# Altium schematic sheet 07-FLASH QCMI SOM.SchDoc: eMMC/QSPI
size 431 x 279 mm; Designer: B. Jordan; DsnPath: G:\My Drive\Quilter Computer - Engineering Assets\NXP i.MX8M-Mini\8MMINILPD4-CPU2-DESIGNFILES\8MMINILPD4-CPU2-DESIGNFILES\SCH-47712_A4.DSN; Author: B. Jordan; DrawnBy: B. Jordan; Revision: 0; SheetNumber: 07; SheetTotal: 10; ENG_APP_DATE: --/--/--; DSN_APP_DATE: --/--/--; CHK_APP_DATE: --/--/--
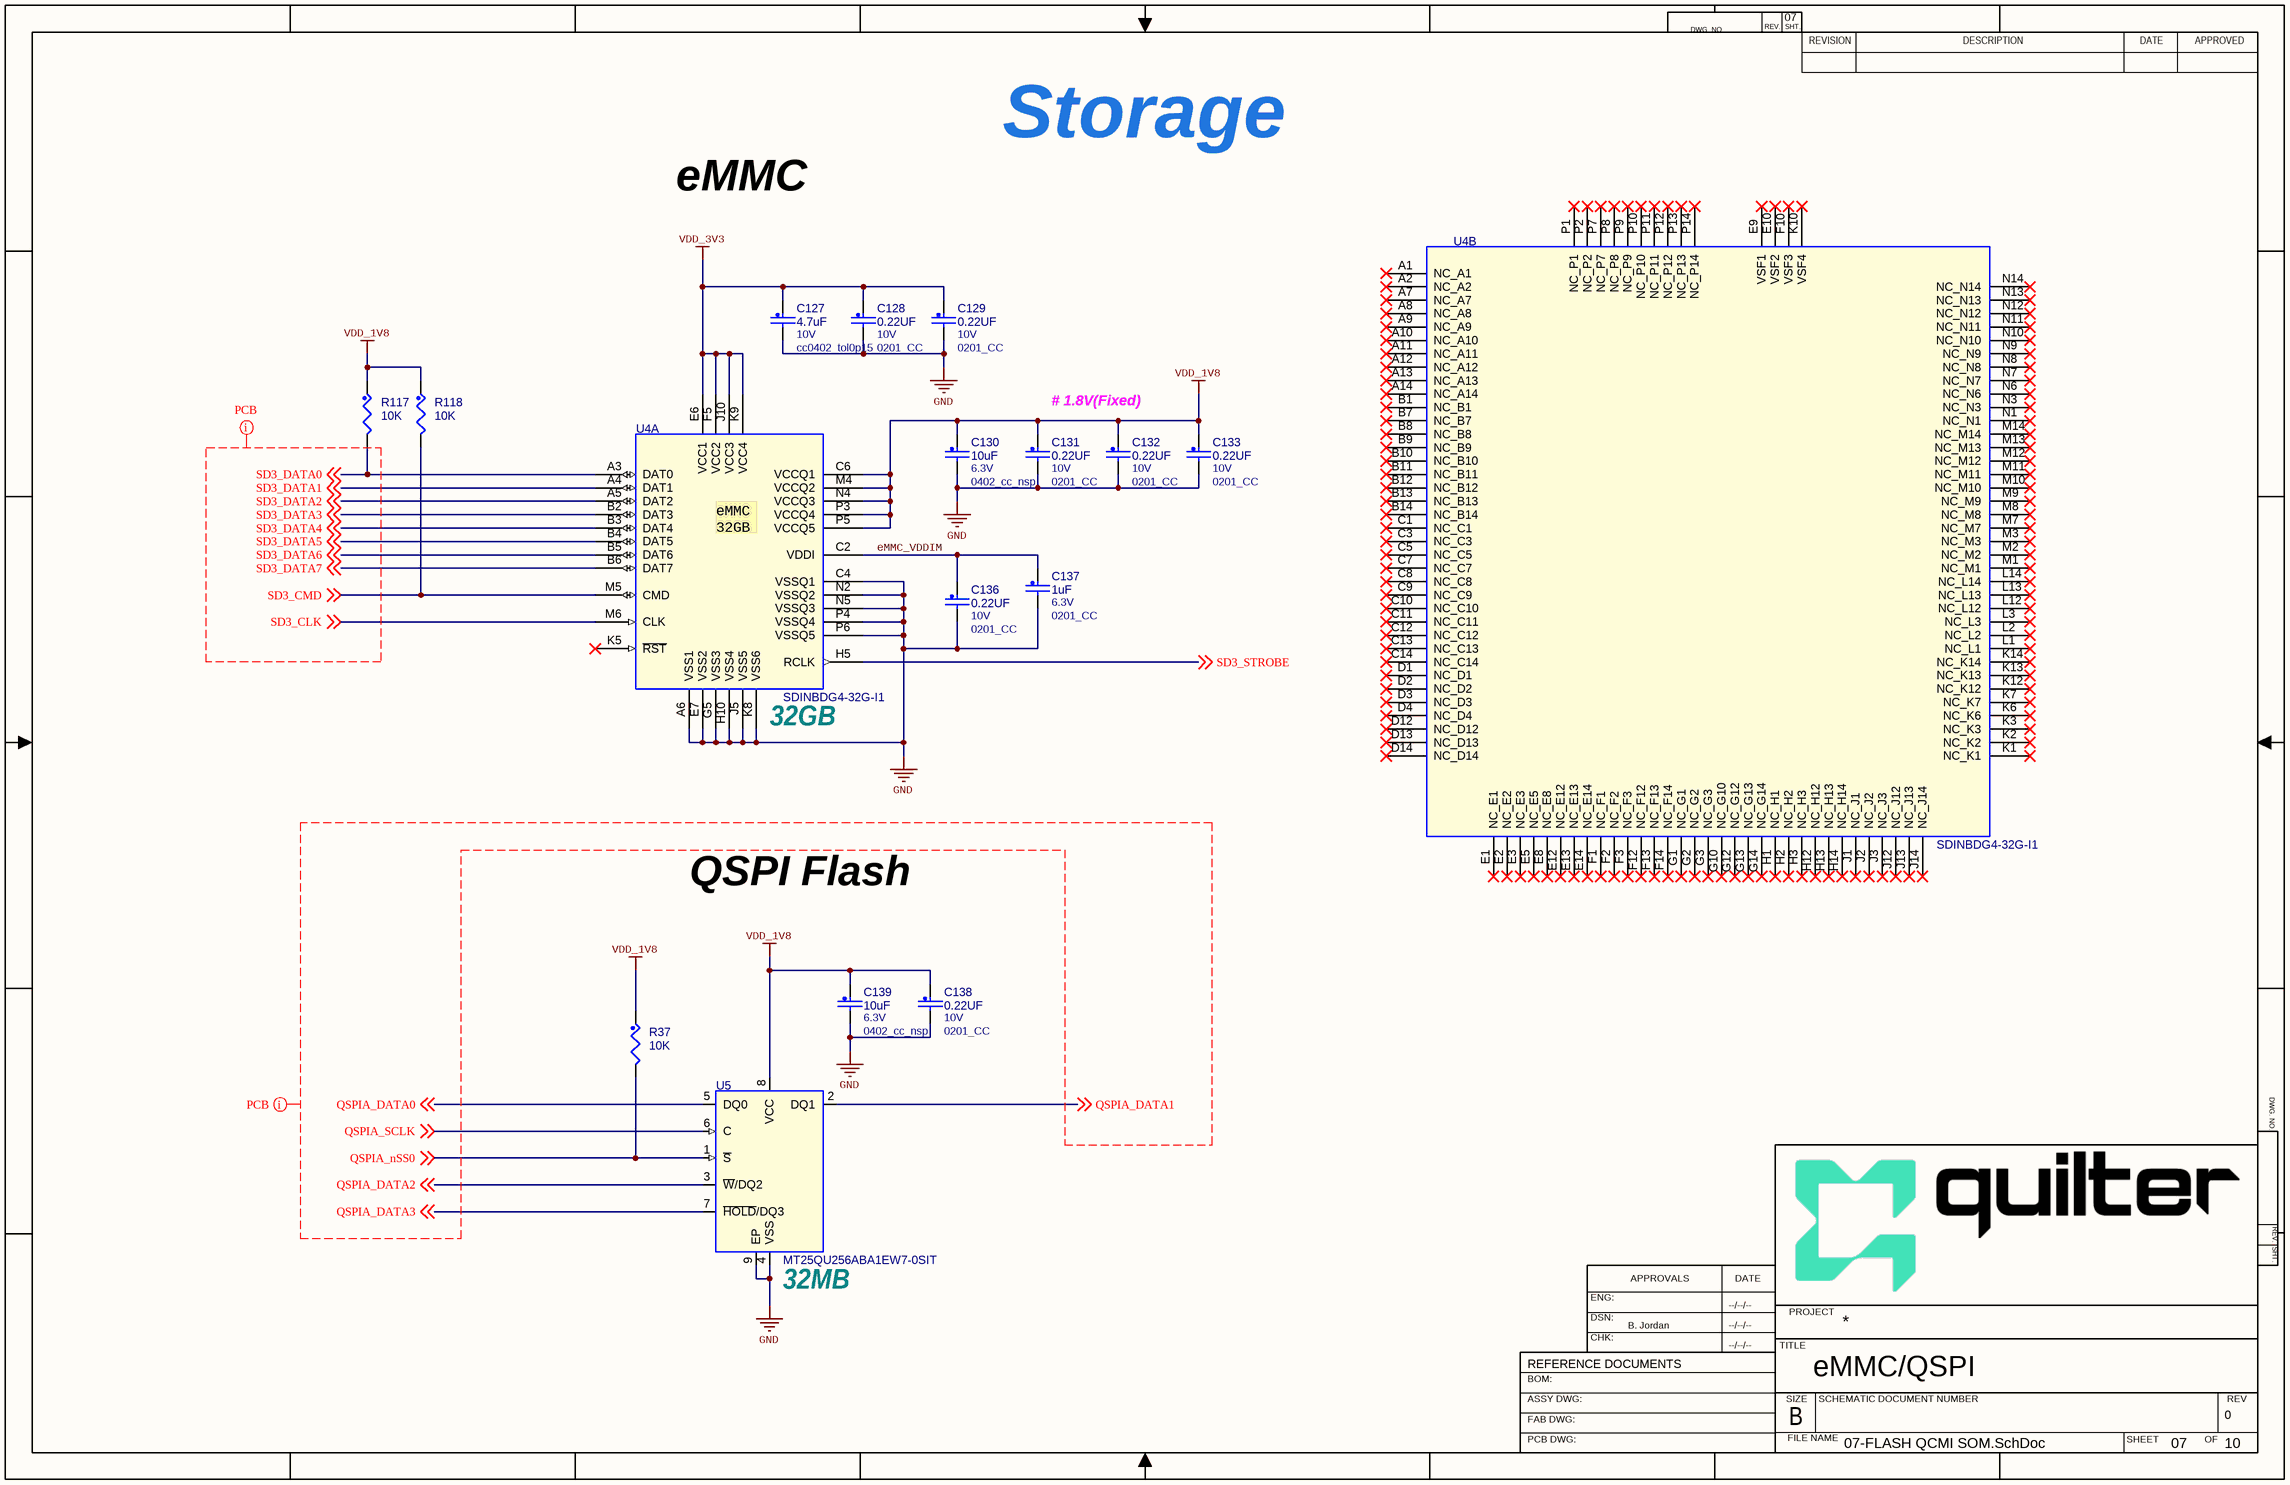
[diagram p0: 07-FLASH QCMI SOM.SchDoc]

## Parts
C127  4.7uF  VOLTAGE: 10V  [cc0402_tol0p15]
C128  0.22UF  VOLTAGE: 10V  [0201_CC]
C129  0.22UF  VOLTAGE: 10V  [0201_CC]
C130  10uF  VOLTAGE: 6.3V  [0402_cc_nsp]
C131  0.22UF  VOLTAGE: 10V  [0201_CC]
C132  0.22UF  VOLTAGE: 10V  [0201_CC]
C133  0.22UF  VOLTAGE: 10V  [0201_CC]
C136  0.22UF  VOLTAGE: 10V  [0201_CC]
C137  1uF  VOLTAGE: 6.3V  [0201_CC]
C138  0.22UF  VOLTAGE: 10V  [0201_CC]
C139  10uF  VOLTAGE: 6.3V  [0402_cc_nsp]
R37  10K  [0402_CC]
R117  10K  [0201_CC]
R118  10K  [0201_CC]
U4  SDINBDG4-32G-I1  [fbga153_0p5_11p5x13]  (parts A,B of 2)
U5  MT25QU256ABA1EW7-0SIT  [dfn8_1p27_6x5mm_3p1]

## Nets
GND: C127.2 C128.2 C129.2 C130.2 C131.2 C132.2 C133.2 C136.2 C137.2 C138.2 C139.2 U4.A6(VSS1) U4.C4(VSSQ1) U4.E7(VSS2) U4.G5(VSS3) U4.H10(VSS4) U4.J5(VSS5) U4.K8(VSS6) U4.N2(VSSQ2) U4.N5(VSSQ3) U4.P4(VSSQ4) U4.P6(VSSQ5) U5.4(VSS) U5.9(EP)
VDD_1V8: C130.1 C131.1 C132.1 C133.1 C138.1 C139.1 R37.1 R117.1 R118.1 U4.C6(VCCQ1) U4.M4(VCCQ2) U4.N4(VCCQ3) U4.P3(VCCQ4) U4.P5(VCCQ5) U5.8(VCC)
VDD_3V3: C127.1 C128.1 C129.1 U4.E6(VCC1) U4.F5(VCC2) U4.J10(VCC3) U4.K9(VCC4)
eMMC_VDDIM: C136.1 C137.1 U4.C2(VDDI)
QSPIA_DATA0: U5.5(DQ0) ; off-sheet QSPIA_DATA0
QSPIA_DATA1: U5.2(DQ1) ; off-sheet QSPIA_DATA1
QSPIA_DATA2: U5.3(~{W}/DQ2) ; off-sheet QSPIA_DATA2
QSPIA_DATA3: U5.7(~{HOLD}/DQ3) ; off-sheet QSPIA_DATA3
QSPIA_nSS0: R37.2 U5.1(~{S}) ; off-sheet QSPIA_nSS0
QSPIA_SCLK: U5.6(C) ; off-sheet QSPIA_SCLK
SD3_CLK: U4.M6(CLK) ; off-sheet SD3_CLK
SD3_CMD: R118.2 U4.M5(CMD) ; off-sheet SD3_CMD
SD3_DATA0: R117.2 U4.A3(DAT0) ; off-sheet SD3_DATA0
SD3_DATA1: U4.A4(DAT1) ; off-sheet SD3_DATA1
SD3_DATA2: U4.A5(DAT2) ; off-sheet SD3_DATA2
SD3_DATA3: U4.B2(DAT3) ; off-sheet SD3_DATA3
SD3_DATA4: U4.B3(DAT4) ; off-sheet SD3_DATA4
SD3_DATA5: U4.B4(DAT5) ; off-sheet SD3_DATA5
SD3_DATA6: U4.B5(DAT6) ; off-sheet SD3_DATA6
SD3_DATA7: U4.B6(DAT7) ; off-sheet SD3_DATA7
SD3_STROBE: U4.H5(RCLK) ; off-sheet SD3_STROBE

Not connected (* = marked no-connect by the designer): U4 A1(NC_A1)* A2(NC_A2)* A7(NC_A7)* A8(NC_A8)* A9(NC_A9)* A10(NC_A10)* A11(NC_A11)* A12(NC_A12)* A13(NC_A13)* A14(NC_A14)* B1(NC_B1)* B7(NC_B7)* B8(NC_B8)* B9(NC_B9)* B10(NC_B10)* B11(NC_B11)* B12(NC_B12)* B13(NC_B13)* B14(NC_B14)* C1(NC_C1)* C3(NC_C3)* C5(NC_C5)* C7(NC_C7)* C8(NC_C8)* C9(NC_C9)* C10(NC_C10)* C11(NC_C11)* C12(NC_C12)* C13(NC_C13)* C14(NC_C14)* D1(NC_D1)* D2(NC_D2)* D3(NC_D3)* D4(NC_D4)* D12(NC_D12)* D13(NC_D13)* D14(NC_D14)* E1(NC_E1)* E2(NC_E2)* E3(NC_E3)* E5(NC_E5)* E8(NC_E8)* E9(VSF1)* E10(VSF2)* E12(NC_E12)* E13(NC_E13)* E14(NC_E14)* F1(NC_F1)* F2(NC_F2)* F3(NC_F3)* F10(VSF3)* F12(NC_F12)* F13(NC_F13)* F14(NC_F14)* G1(NC_G1)* G2(NC_G2)* G3(NC_G3)* G10(NC_G10)* G12(NC_G12)* G13(NC_G13)* G14(NC_G14)* H1(NC_H1)* H2(NC_H2)* H3(NC_H3)* H12(NC_H12)* H13(NC_H13)* H14(NC_H14)* J1(NC_J1)* J2(NC_J2)* J3(NC_J3)* J12(NC_J12)* J13(NC_J13)* J14(NC_J14)* K1(NC_K1)* K2(NC_K2)* K3(NC_K3)* K5(~{RST})* K6(NC_K6)* K7(NC_K7)* K10(VSF4)* K12(NC_K12)* K13(NC_K13)* K14(NC_K14)* L1(NC_L1)* L2(NC_L2)* L3(NC_L3)* L12(NC_L12)* L13(NC_L13)* L14(NC_L14)* M1(NC_M1)* M2(NC_M2)* M3(NC_M3)* M7(NC_M7)* M8(NC_M8)* M9(NC_M9)* M10(NC_M10)* M11(NC_M11)* M12(NC_M12)* M13(NC_M13)* M14(NC_M14)* N1(NC_N1)* N3(NC_N3)* N6(NC_N6)* N7(NC_N7)* N8(NC_N8)* N9(NC_N9)* N10(NC_N10)* N11(NC_N11)* N12(NC_N12)* N13(NC_N13)* N14(NC_N14)* P1(NC_P1)* P2(NC_P2)* P7(NC_P7)* P8(NC_P8)* P9(NC_P9)* P10(NC_P10)* P11(NC_P11)* P12(NC_P12)* P13(NC_P13)* P14(NC_P14)*

## Layout directives
net class EMMC_SD3; rule Matched Net Lengths [Delay Tolerance = 100ps]: SD3_CLK, SD3_CMD, SD3_DATA0, SD3_DATA1, SD3_DATA2, SD3_DATA3, SD3_DATA4, SD3_DATA5, SD3_DATA6, SD3_DATA7
net class QSPI; rule Matched Net Lengths [Delay Tolerance = 100ps]: QSPIA_DATA0, QSPIA_DATA1, QSPIA_DATA2, QSPIA_DATA3, QSPIA_nSS0, QSPIA_SCLK

## Notes on the sheet
- Storage
- eMMC
- # 1.8V(Fixed)
- (near U4) 32GB
- QSPI Flash
- (near U5) 32MB
- DWG. NO.
- REV.
- SHT.
- REVISION
- DESCRIPTION
- DATE
- APPROVED
- ENG:
- APPROVALS
- REFERENCE DOCUMENTS
- DSN:
- CHK:
- TITLE
- PROJECT
- BOM:
- ASSY DWG:
- FAB DWG:
- SIZE
- FILE NAME
- B
- SCHEMATIC DOCUMENT NUMBER
- SHEET
- OF
- REV
- PCB DWG:
- (in symbol SDINBDG4-16G_VFBGA_153P, part A) eMMC / 32GB

## Library data of the parts
C127 = CAP_NP: CAP CER 4.7uF 10V 10% X5R 0402; MFG_NAME01: SAMSUNG ELECTRO MECHANICS; MFG_PN01: CL05A475KP5NRNC; EIA Case: 0402; Temp Range: -55°C ~ 125°C; Value: 4.7uF; Tolerance: 10%; ROHS: Yes; PCB Footprint: cc0402_tol0p15
C128 C131-C133 = CAP_NP: CAP CER 0.22UF 10V 20% X5R 0201; MFG_NAME01: Taiyo Yuden; MFG_PN01: LMK063BJ224MP-F; EIA Case: 0201; Temp Range: -55°C ~ 125°C; Value: 0.22UF; PCB Footprint: 0201_CC; Tolerance: 20%; ROHS: Yes
C129 C136 C138 = CAP_NP: CAP CER 0.22UF 10V 20% X5R 0201; MFG_PN01: LMK063BJ224MP-F; MFG_NAME01: Taiyo Yuden; EIA Case: 0201; Temp Range: -55°C ~ 125°C; Value: 0.22UF; PCB Footprint: 0201_CC; ROHS: Yes; Tolerance: 20%
C130 = CAP_NP: CAP CER 10UF 6.3V 20% X5R 0402; MFG_NAME01: SAMSUNG ELECTRO MECHANICS; MFG_PN01: CL05A106MQ5NUNC; EIA Case: 0402; Temp Range: -55°C ~ 125°C; Value: 10uF; Tolerance: 20%; ROHS: Yes; PCB Footprint: 0402_cc_nsp
C137 = CAP_NP: CAP CER 1uF 6.3V 20% X5R 0201; MFG_NAME01: AVX; MFG_PN01: 02016D105MAT2A; EIA Case: 0201; Temp Range: -55°C ~ 125°C; Value: 1uF; PCB Footprint: 0201_CC; Tolerance: 20%; ROHS: Yes
C139 = CAP_NP: CAP CER 10UF 6.3V 20% X5R 0402; MFG_PN01: CL05A106MQ5NUNC; MFG_NAME01: SAMSUNG ELECTRO MECHANICS; EIA Case: 0402; Temp Range: -55°C ~ 125°C; Value: 10uF; ROHS: Yes; Tolerance: 20%; PCB Footprint: 0402_cc_nsp
R37 = RES: RES MF 10K 1/16W 5% 0402; MFG_NAME01: VISHAY INTERTECHNOLOGY; MFG_PN01: CRCW040210K0JNED; EIA Case: 0402; Value: 10K; PCB Footprint: 0402_CC; Tolerance: 5%; ROHS: Yes; Rated Power: 1/16W
R117 R118 = RES: RES MF 10K 1/20W 5% 0201; MFG_PN01: RTT01103JTH; MFG_NAME01: RALEC ELECTRONIC CORP; EIA Case: 0201; Value: 10K; PCB Footprint: 0201_CC; ROHS: Yes; Tolerance: 5%; Rated Power: 1/20W
U4 = SDINBDG4-16G_VFBGA_153P: IC MEM NAND FLASH 32GB eMMC 5.1 CTLR 2.7-3.6V FBGA153; EIA Case: 11.5 mm x 13 mm x 1 mm; Temp Range: -25°C ~ 85°C; MFG_NAME01: SanDisk; JEDEC Case: BGA153; Value: SDINBDG4-32G-I1; PCB Footprint: fbga153_0p5_11p5x13; ROHS: YES; VOLTAGE: 2.7-3.6V; MFG_PN01: SDINBDG4-32G-I1
U5 = MT25QL256ABA1EW9_9P: IC MEM FLASH SERIAL NOR 256MBIT 166MHZ 1.7-2V WPDFN8; MFG_NAME01: MICRON; Value: MT25QU256ABA1EW7-0SIT; PCB Footprint: dfn8_1p27_6x5mm_3p1; MFG_PN01: MT25QU256ABA1EW7-0SIT; ROHS: Yes; VOLTAGE: 1.7-2V